# Altium schematic sheet type_A_input.SchDoc
size A; SheetNumber: 1; SheetTotal: 4
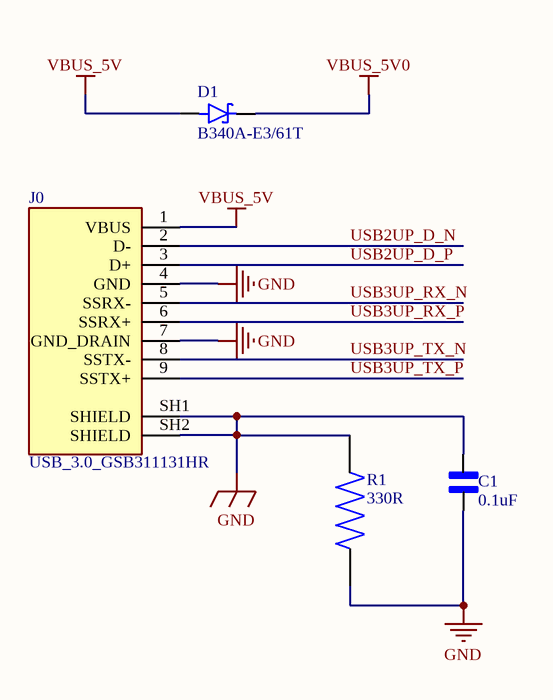
[diagram p0: type_A_input.SchDoc]

## Parts
C1  0.1uF  [CAPC1608X94N]
D1  B340A-E3/61T  [DIOM5126X229N]
J0  USB_3.0_GSB311131HR  [USB 3.0]
R1  330R  [RES_ERJU03J474V]

## Nets
GND: C1.1 C1.2 J0.4(GND) J0.7(GND_DRAIN) J0.SH1(SHIELD) J0.SH2(SHIELD) R1.1 R1.2
VBUS_5V: D1.A J0.1(VBUS)
VBUS_5V0: D1.C
USB2UP_D_N: J0.2(D-)
USB2UP_D_P: J0.3(D+)
USB3UP_RX_N: J0.5(SSRX-)
USB3UP_RX_P: J0.6(SSRX+)
USB3UP_TX_N: J0.8(SSTX-)
USB3UP_TX_P: J0.9(SSTX+)

## Library data of the parts
C1 = cap_0603_VJ0603D3R9DXCAP: cap 0603 (1608 Metric); MF: Vishay Vitramon; SnapEDA_Link: https://www.snapeda.com/parts/VJ0603D3R9DXCAP/Vishay/view-part/?ref=snap; Package: 1608 Vishay Vitramon; Value: *; MP: VJ0603D3R9DXCAP; Check_prices: https://www.snapeda.com/parts/VJ0603D3R9DXCAP/Vishay/view-part/?ref=eda
D1 = B340A-E3/61T: Diode Schottky 40 V 3A Surface Mount DO-214AC (SMA); MF: Vishay Semiconductor; SnapEDA_Link: https://www.snapeda.com/parts/B340A-E3/61T/Vishay/view-part/?ref=snap; Package: DO-214 Vishay Semiconductor; Value: *; MP: B340A-E3/61T; Check_prices: https://www.snapeda.com/parts/B340A-E3/61T/Vishay/view-part/?ref=eda
J0 = USB_3.0_GSB311131HR: USB-A _USB TYPE-A_ USB 3.0 _USB 3.1 Gen 1, Superspeed_ Receptacle Connector 9 Position Through Hole, Right Angle / GSB311131HR; MF: Amphenol ICC; Package: None; Digi-Key_Purchase_URL: https://www.digikey.ru/product-detail/en/amphenol-icc-commercial-products/GSB311131HR/GSB311131HR-ND/2187173?utm_source=snapeda&utm_medium=aggregator&utm_campaign=symbol; Value: *; MP: GSB311131HR; SnapEDA_Link: https://www.snapeda.com/parts/GSB311131HR/Amphenol%20FCI/view-part/229215/?ref=snap; Digi-Key_Part_Number: GSB311131HR-ND
R1 = res_0603_ERJU03J474V: 0603 Anti-Sulfurated; MF: Panasonic; SnapEDA_Link: https://www.snapeda.com/parts/ERJU03J474V/Panasonic/view-part/?ref=snap; Package: 1608-2 Panasonic; Value: *; MP: ERJU03J474V; Check_prices: https://www.snapeda.com/parts/ERJU03J474V/Panasonic/view-part/?ref=eda